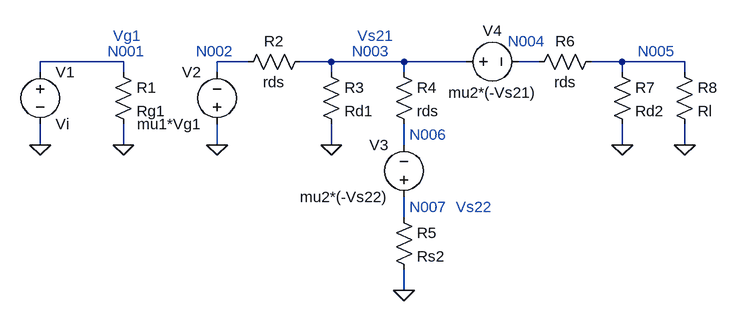
[diagram p0: schematic Ampli_BW.asc]
Ampli_BW.asc, the LTspice schematic file:
Version 4.1
SHEET 1 1000 680
WIRE 80 96 -48 96
WIRE 272 96 224 96
WIRE 400 96 352 96
WIRE 512 96 400 96
WIRE 608 96 512 96
WIRE 720 96 688 96
WIRE 848 96 800 96
WIRE 944 96 848 96
WIRE -48 112 -48 96
WIRE 80 112 80 96
WIRE 224 112 224 96
WIRE 400 112 400 96
WIRE 512 112 512 96
WIRE 848 112 848 96
WIRE 944 112 944 96
WIRE -48 224 -48 192
WIRE 80 224 80 192
WIRE 224 224 224 192
WIRE 400 224 400 192
WIRE 512 224 512 192
WIRE 848 224 848 192
WIRE 944 224 944 192
WIRE 512 336 512 304
WIRE 512 448 512 416
FLAG -48 224 0
FLAG 80 224 0
FLAG 224 224 0
FLAG 400 224 0
FLAG 848 224 0
FLAG 944 224 0
FLAG 512 448 0
SYMBOL voltage -48 96 R0
SYMATTR InstName V1
SYMATTR Value Vi
SYMBOL res 64 96 R0
SYMATTR InstName R1
SYMATTR Value Rg1
SYMBOL voltage 224 208 R180
WINDOW 0 24 96 Left 2
WINDOW 3 24 16 Left 2
SYMATTR InstName V2
SYMATTR Value mu1*Vg1
SYMBOL res 368 80 R90
WINDOW 0 0 56 VBottom 2
WINDOW 3 32 56 VTop 2
SYMATTR InstName R2
SYMATTR Value rds
SYMBOL res 384 96 R0
SYMATTR InstName R3
SYMATTR Value Rd1
SYMBOL res 496 96 R0
SYMATTR InstName R4
SYMATTR Value rds
SYMBOL voltage 512 320 R180
WINDOW 0 24 96 Left 2
WINDOW 3 24 16 Left 2
SYMATTR InstName V3
SYMATTR Value mu2*(-Vs22)
SYMBOL res 496 320 R0
SYMATTR InstName R5
SYMATTR Value Rs2
SYMBOL voltage 592 96 R270
WINDOW 0 32 56 VTop 2
WINDOW 3 -32 56 VBottom 2
SYMATTR InstName V4
SYMATTR Value mu2*(-Vs21)
SYMBOL res 816 80 R90
WINDOW 0 0 56 VBottom 2
WINDOW 3 32 56 VTop 2
SYMATTR InstName R6
SYMATTR Value rds
SYMBOL res 832 96 R0
SYMATTR InstName R7
SYMATTR Value Rd2
SYMBOL res 928 96 R0
SYMATTR InstName R8
SYMATTR Value Rl
TEXT 56 80 Left 2 ;N001
TEXT 192 80 Left 2 ;N002
TEXT 432 80 Left 2 ;N003
TEXT 520 208 Left 2 ;N006
TEXT 672 64 Left 2 ;N004
TEXT 520 320 Left 2 ;N007
TEXT 872 80 Left 2 ;N005
TEXT 64 56 Left 2 ;Vg1
TEXT 592 320 Left 2 ;Vs22
TEXT 440 56 Left 2 ;Vs21

The netlist it stands for:
* Ampli_BW.asc
V1 N001 0 Vi
R1 N001 0 Rg1
V2 0 N002 mu1*Vg1
R2 N003 N002 rds
R3 N003 0 Rd1
R4 N003 N006 rds
V3 N007 N006 mu2*(-Vs22)
R5 N007 0 Rs2
V4 N003 N004 mu2*(-Vs21)
R6 N005 N004 rds
R7 N005 0 Rd2
R8 N005 0 Rl
* N001
* N002
* N003
* N006
* N004
* N007
* N005
* Vg1
* Vs22
* Vs21
.backanno
.end